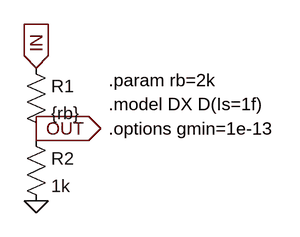
[diagram p0: schematic hier_directives.asc]
hier_directives.asc, the LTspice schematic file:
Version 4
SHEET 1 880 680
WIRE 0 96 0 112
FLAG 0 16 IN
IOPIN 0 16 In
FLAG 0 96 OUT
IOPIN 0 96 Out
FLAG 0 192 0
SYMBOL res -16 0 R0
SYMATTR InstName R1
SYMATTR Value {rb}
SYMBOL res -16 96 R0
SYMATTR InstName R2
SYMATTR Value 1k
TEXT 96 32 Left 2 !.param rb=2k
TEXT 96 64 Left 2 !.model DX D(Is=1f)
TEXT 96 96 Left 2 !.options gmin=1e-13

The netlist it stands for:
* hier_directives.asc
R1 IN OUT {rb}
R2 OUT 0 1k
.param rb=2k
.model DX D(Is=1f)
.options gmin=1e-13
.backanno
.end